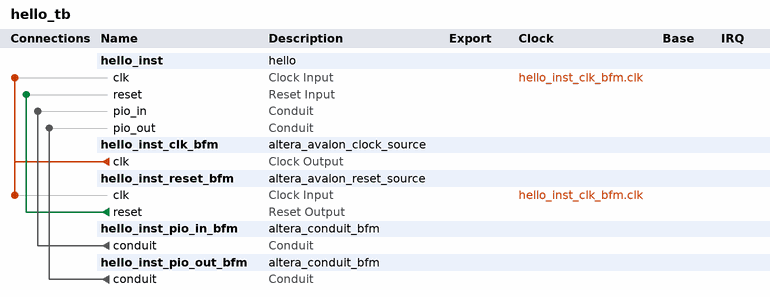
[diagram p0: system contents]
# Platform Designer (Qsys) system hello_tb, Cyclone V 5CSEMA5F31C6
# Parameters at their usual value, and those the tool derives, are not listed.
package require -exact qsys 25.1
create_system hello_tb
set_project_property DEVICE_FAMILY {Cyclone V}
set_project_property DEVICE 5CSEMA5F31C6

add_instance hello_inst hello 1.0

add_instance hello_inst_clk_bfm altera_avalon_clock_source 25.1

add_instance hello_inst_reset_bfm altera_avalon_reset_source 25.1
set_instance_parameter_value hello_inst_reset_bfm ASSERT_HIGH_RESET 0
set_instance_parameter_value hello_inst_reset_bfm INITIAL_RESET_CYCLES 50

add_instance hello_inst_pio_in_bfm altera_conduit_bfm 25.1
set_instance_parameter_value hello_inst_pio_in_bfm CLOCKED_SIGNAL false
set_instance_parameter_value hello_inst_pio_in_bfm ENABLE_RESET false
set_instance_parameter_value hello_inst_pio_in_bfm SIGNAL_DIRECTIONS output
set_instance_parameter_value hello_inst_pio_in_bfm SIGNAL_WIDTHS 4

add_instance hello_inst_pio_out_bfm altera_conduit_bfm 25.1
set_instance_parameter_value hello_inst_pio_out_bfm CLOCKED_SIGNAL false
set_instance_parameter_value hello_inst_pio_out_bfm ENABLE_RESET false
set_instance_parameter_value hello_inst_pio_out_bfm SIGNAL_DIRECTIONS input
set_instance_parameter_value hello_inst_pio_out_bfm SIGNAL_WIDTHS 8

# connections
add_connection hello_inst_clk_bfm.clk hello_inst.clk clock
add_connection hello_inst_clk_bfm.clk hello_inst_reset_bfm.clk clock
add_connection hello_inst_reset_bfm.reset hello_inst.reset reset
add_connection hello_inst_pio_in_bfm.conduit hello_inst.pio_in conduit
add_connection hello_inst_pio_out_bfm.conduit hello_inst.pio_out conduit

set_interconnect_requirement {$system} qsys_mm.clockCrossingAdapter HANDSHAKE
set_interconnect_requirement {$system} qsys_mm.enableEccProtection FALSE
set_interconnect_requirement {$system} qsys_mm.insertDefaultSlave FALSE
set_interconnect_requirement {$system} qsys_mm.maxAdditionalLatency 1

save_system hello_tb.qsys
